# Altium schematic sheet Sheet1.SchDoc
size A
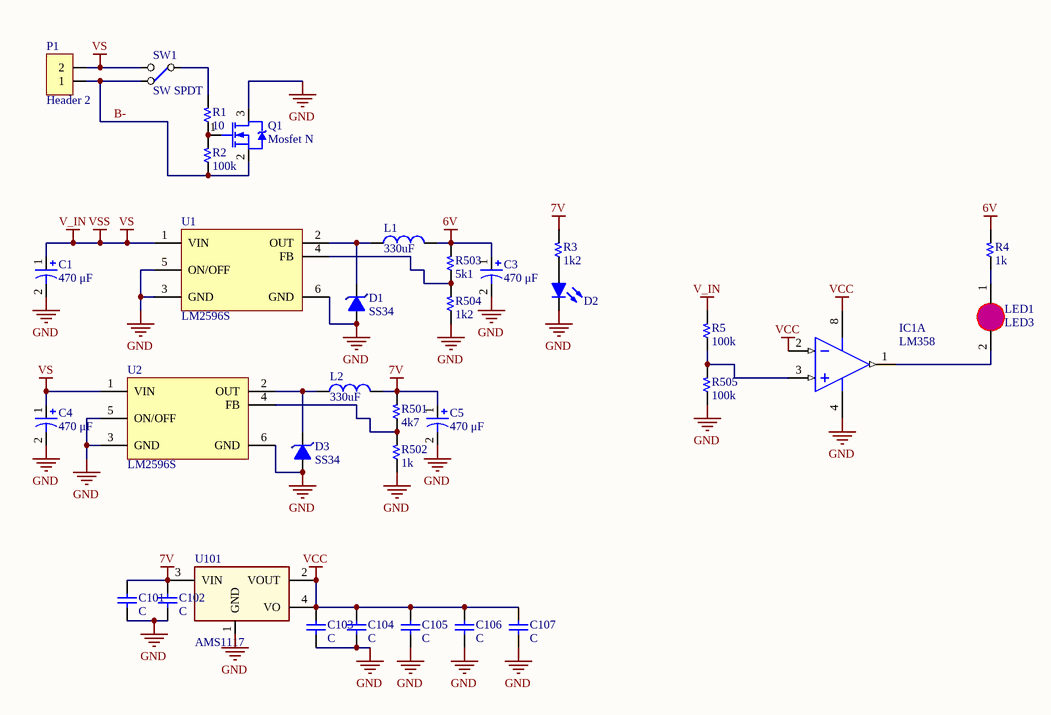
[diagram p0: Sheet1.SchDoc]

## Parts
C1  470 μF  [WCAP-PSHP 8x7.7x3.1]
C3  470 μF  [WCAP-PSHP 8x7.7x3.1]
C4  470 μF  [WCAP-PSHP 8x7.7x3.1]
C5  470 μF  [WCAP-PSHP 8x7.7x3.1]
C101  C  [C 0805]
C102  C  [C 0805]
C103  C  [C 0805]
C104  C  [C 0805]
C105  C  [C 0805]
C106  C  [C 0805]
C107  C  [C 0805]
D1  SS34  [DO-214AC (SMA) L]
D2  Led  [Led 0805 Blue]  (value not drawn)
D3  SS34  [DO-214AC (SMA) L]
IC1  LM358  [SOIC-8]  (part A of 2)
L1  330uF  [1210]
L2  330uF  [1210]
LED1  LED3  [Led 0805 Blue]
P1  Header 2  [HDR/Terminal/2/5mm]
Q1  Mosfet N  [TO-252 (DPAK)]
R1  10  [R 0805]
R2  100k  [R 0805]
R3  1k2  [R 0805]
R4  1k  [R 0805]
R5  100k  [R 0805]
R501  4k7  [R 0805]
R502  1k  [R 0805]
R503  5k1  [R 0805]
R504  1k2  [R 0805]
R505  100k  [R 0805]
SW1  SW SPDT  [SW/3/SPDT/SS12D10]
U1  LM2596S  [TO263 5]
U2  LM2596S  [TO263 5]
U101  AMS1117  [SOT-223]

## Nets
6V: C3.1 L1.2 R4.2 R503.2
7V: C5.1 C101.1 C102.1 L2.2 R3.2 R501.2 U101.3(VIN)
GND: C1.2 C3.2 C4.2 C5.2 C101.2 C102.2 C103.2 C104.2 C105.2 C106.2 C107.2 D1.1(A) D2.2(K) D3.1(A) IC1.4(GND) Q1.3(D) R502.1 R504.1 R505.1 U1.3(GND) U1.5(ON/OFF) U1.6(GND) U2.3(GND) U2.5(ON/OFF) U2.6(GND) U101.1(GND)
V_IN: C1.1 C4.1 P1.2 R5.2 SW1.3(NO1) U1.1(VIN) U2.1(VIN)  [also labelled VS, VSS]
VCC: C103.1 C104.1 C105.1 C106.1 C107.1 IC1.2(INA-) IC1.8(V+) U101.2(VOUT) U101.4(VO)
B-: P1.1 Q1.2(S) R2.1 SW1.1(NC1)
NetD1_2: D1.2(K) L1.1 U1.2(OUT)
NetD2_1: D2.1(A) R3.1
NetD3_2: D3.2(K) L2.1 U2.2(OUT)
NetIC1_1: IC1.1(OUTA) LED1.2(K)
NetIC1_3: IC1.3(INA+) R5.1 R505.2
NetLED1_1: LED1.1(A) R4.1
NetQ1_1: Q1.1(G) R1.1 R2.2
NetR1_2: R1.2 SW1.2(COMMON1)
NetR501_1: R501.1 R502.2 U2.4(FB)
NetR503_1: R503.1 R504.2 U1.4(FB)

## Library data of the parts
C1 C3-C5 = WCAP-PSHP 8x7.7x3.1 875115150001: WCAP-PSHP Aluminum Polymer Capacitors , 220 μF; + / - 20%; 6,3 V , 8 x 7,7; Manufacturer: Wurth Elektronik; E-mail: libraries@we-online.com; Characteristics: Aluminum Polymer Capacitors;Recommended soldering: Reflow;Operating temperature: –55 °C to +105 °C;Miniaturized product series;Low ESR at high frequency range;High permissible ripple current;Load life: 2000 h @ +105 °C; ComponentLink1Description: Manufacturer; ComponentLink1URL: http://www.we-online.com; ComponentLink2Description: Datasheet; ComponentLink2URL: http://katalog.we-online.de/pbs/datasheet/875115150001.pdf; Created by: Karrer Zheng; Created Date: 5/13/2015; Capacitance: 470 μF; Application: Low voltage port filtering, appplid to high-end switching power supply, PC(desktop,laptop ),industrial computer, VGA card, server power, charger, TV, digital set-top box,DC-DC power module, game machine etc which consume large current with high speed circuit.; partNo: 875115150001
C101-C107 = Capacitor NP: Capacitor non-pol
D1 D3 = Zener
D2 = Led: Typical LED
IC1 = LM358: Low Power Dual Operational Amplifier, 8-pin MDIP; PartNumber: LM358AN; Manufacturer: National Semiconductor; PackageTopMarking: NSUZXYTTE#*LM*358AN; PowerWise: N; CompType: Amplifiers; Published: 4-Dec-2008; LatestRevisionDate: 13-Jan-2009; LatestRevisionNote: Sim Model Added.; DatasheetVersion: Oct-2005; PackageVersion: revG, May-2006; PackageReference: N08E; Publisher: Altium Limited; PackageDescription: MDIP, .365 x .250 x .130in, 8 Lead, .100in Pitch; Supplier 1: Farnell; Supplier Part Number 1: 9486810; RoHS: N; PinCount: 8; Code_JEDEC: MS-001-BA; ComponentLink1Description: LM358 Datasheet; ComponentLink1URL: http://www.national.com/ds/LM/LM358.pdf; ComponentLink2Description: LM358 Web Page; ComponentLink2URL: http://www.national.com/pf/LM/LM358.html; ComponentLink3Description: N08E Package Page; ComponentLink3URL: http://www.national.com/packaging/folders/n08e.html
L1 L2 = Component_1
LED1 = LEDSMD: LED 3mm
P1 = Header 2: Header, 2-Pin
Q1 = Mosfet N: pin to pad: 2>3 3>2
R1-R5 R501-R505 = Resistor
U101 = AMS1117: 1A LDO Voltage Regulator, ADJ or fixed 1.5/1.8/2.5/2.85/3.3/5V